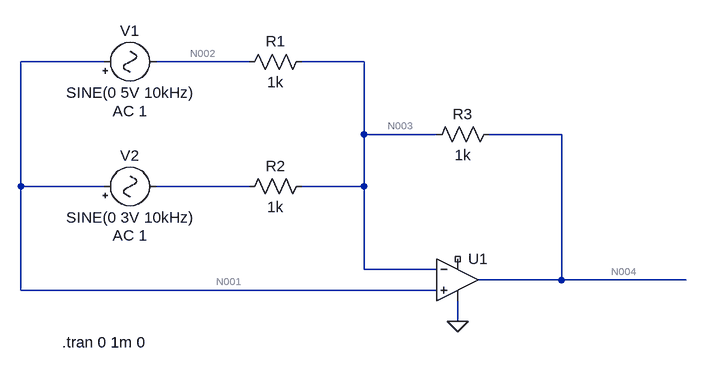
[diagram p0: schematic Draft5.asc]
Draft5.asc, the LTspice schematic file:
Version 4
SHEET 1 2424 680
WIRE 1232 128 1104 128
WIRE 1456 128 1312 128
WIRE 1632 128 1536 128
WIRE 1632 240 1632 128
WIRE 1744 240 1632 240
WIRE 1936 240 1824 240
WIRE 1104 320 1104 128
WIRE 1232 320 1104 320
WIRE 1456 320 1312 320
WIRE 1632 320 1632 240
WIRE 1632 320 1536 320
WIRE 1632 448 1632 320
WIRE 1744 448 1632 448
WIRE 1936 464 1936 240
WIRE 1936 464 1808 464
WIRE 2128 464 1936 464
WIRE 1104 480 1104 320
WIRE 1744 480 1104 480
WIRE 1776 528 1776 496
FLAG 1776 528 0
SYMBOL Misc\\signal 1216 128 R270
WINDOW 0 32 56 VTop 2
WINDOW 3 -32 56 VBottom 2
WINDOW 123 -60 56 VBottom 2
WINDOW 39 0 0 Left 0
SYMATTR InstName V1
SYMATTR Value SINE(0 5V 10kHz)
SYMATTR Value2 AC 1
SYMBOL Misc\\signal 1216 320 R270
WINDOW 0 32 56 VTop 2
WINDOW 3 -32 56 VBottom 2
WINDOW 123 -60 56 VBottom 2
WINDOW 39 0 0 Left 0
SYMATTR InstName V2
SYMATTR Value SINE(0 3V 10kHz)
SYMATTR Value2 AC 1
SYMBOL res 1552 112 R90
WINDOW 0 0 56 VBottom 2
WINDOW 3 32 56 VTop 2
SYMATTR InstName R1
SYMATTR Value 1k
SYMBOL res 1552 304 R90
WINDOW 0 0 56 VBottom 2
WINDOW 3 32 56 VTop 2
SYMATTR InstName R2
SYMATTR Value 1k
SYMBOL res 1840 224 R90
WINDOW 0 0 56 VBottom 2
WINDOW 3 32 56 VTop 2
SYMATTR InstName R3
SYMATTR Value 1k
SYMBOL OpAmps\\UniversalOpAmp2 1776 464 R0
SYMATTR InstName U1
SYMATTR Value2 Avol=10Meg GBW=10Meg Slew=10Meg
SYMATTR SpiceLine Ilimit=25m Rail=1 Vos=0
TEXT 1168 560 Left 2 !.tran 0 1m 0

The netlist it stands for:
* Draft5.asc
V1 N001 N002 SINE(0 5V 10kHz) AC 1
V2 N001 N005 SINE(0 3V 10kHz) AC 1
R1 N003 N002 1k
R2 N003 N005 1k
R3 N004 N003 1k
XU1 N001 N003 NC_01 0 N004 level2 Avol=10Meg GBW=10Meg Slew=10Meg Ilimit=25m Rail=1 Vos=0 En=0 Enk=0 In=0 Ink=0 Rin=500Meg  ; pins In+ In- V+ V- OUT
.tran 0 1m 0
.lib UniversalOpAmp2.lib
.backanno
.end

* Results of the author's LTspice run, read from the files saved beside the schematic
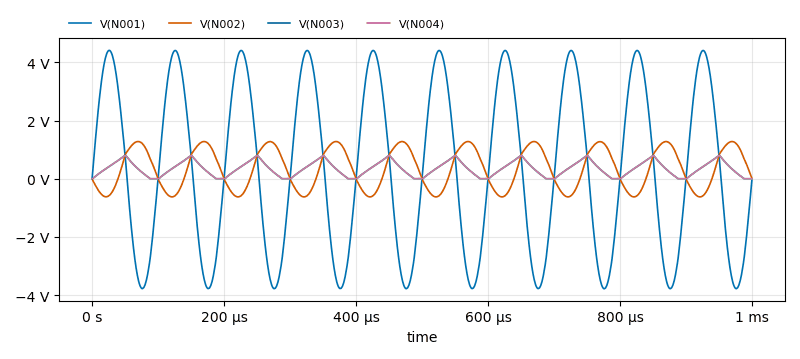
[diagram p1: Transient Analysis of Draft5.asc, plotted from the saved traces]
* Transient Analysis, 1 run:
*   V(N001): min -3.785 V, max 4.414 V, average 341.9 mV, rms 2.926 V, last -492.2 µV
*   V(N002): min -625.2 mV, max 1.281 V, average 341.1 mV, rms 765.7 mV, last -492.2 µV
*   V(N003): min -618.2 µV, max 804.8 mV, average 341.2 mV, rms 424.1 mV, last -492.2 µV
*   V(N004): min -619.3 µV, max 804.8 mV, average 341.2 mV, rms 424.1 mV, last -492.2 µV